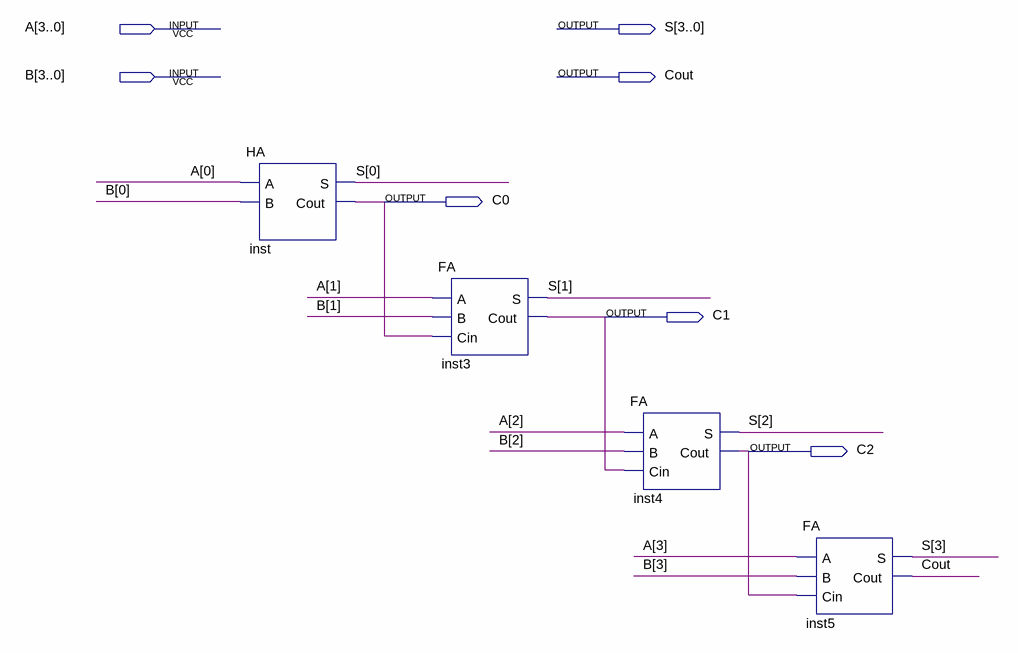
[diagram p0: schematic sheet]
// Quartus schematic RCA4.bdf as structural Verilog: 4 symbols, 7 pins
module RCA4 (
  input  [3:0] A,
  input  [3:0] B,
  output [3:0] S,
  output Cout,
  output C0,
  output C1,
  output C2
);

  HA inst (.A(A[0]), .B(B[0]), .S(S[0]), .Cout(C0));
  FA inst3 (.A(A[1]), .B(B[1]), .Cin(C0), .S(S[1]), .Cout(C1));
  FA inst4 (.A(A[2]), .B(B[2]), .Cin(C1), .S(S[2]), .Cout(C2));
  FA inst5 (.A(A[3]), .B(B[3]), .Cin(C2), .S(S[3]), .Cout(Cout));
endmodule
